# Altium schematic sheet P2.schdoc
size 594 x 421 mm; Symbol: Sheet-Symbol_A4; Company: 嘉立创EDA; Version: V1.0; Page Size: A2; @Project Name: 基于裕太微YT9215S的五口千兆交换机; @Page Count: 2; @Update Date: 2023-09-12; @Create Date: 2023-09-12; @Schematic Name: schematic1; @Page No: 2; @Page Name: P2; Device: Sheet-Symbol_A4
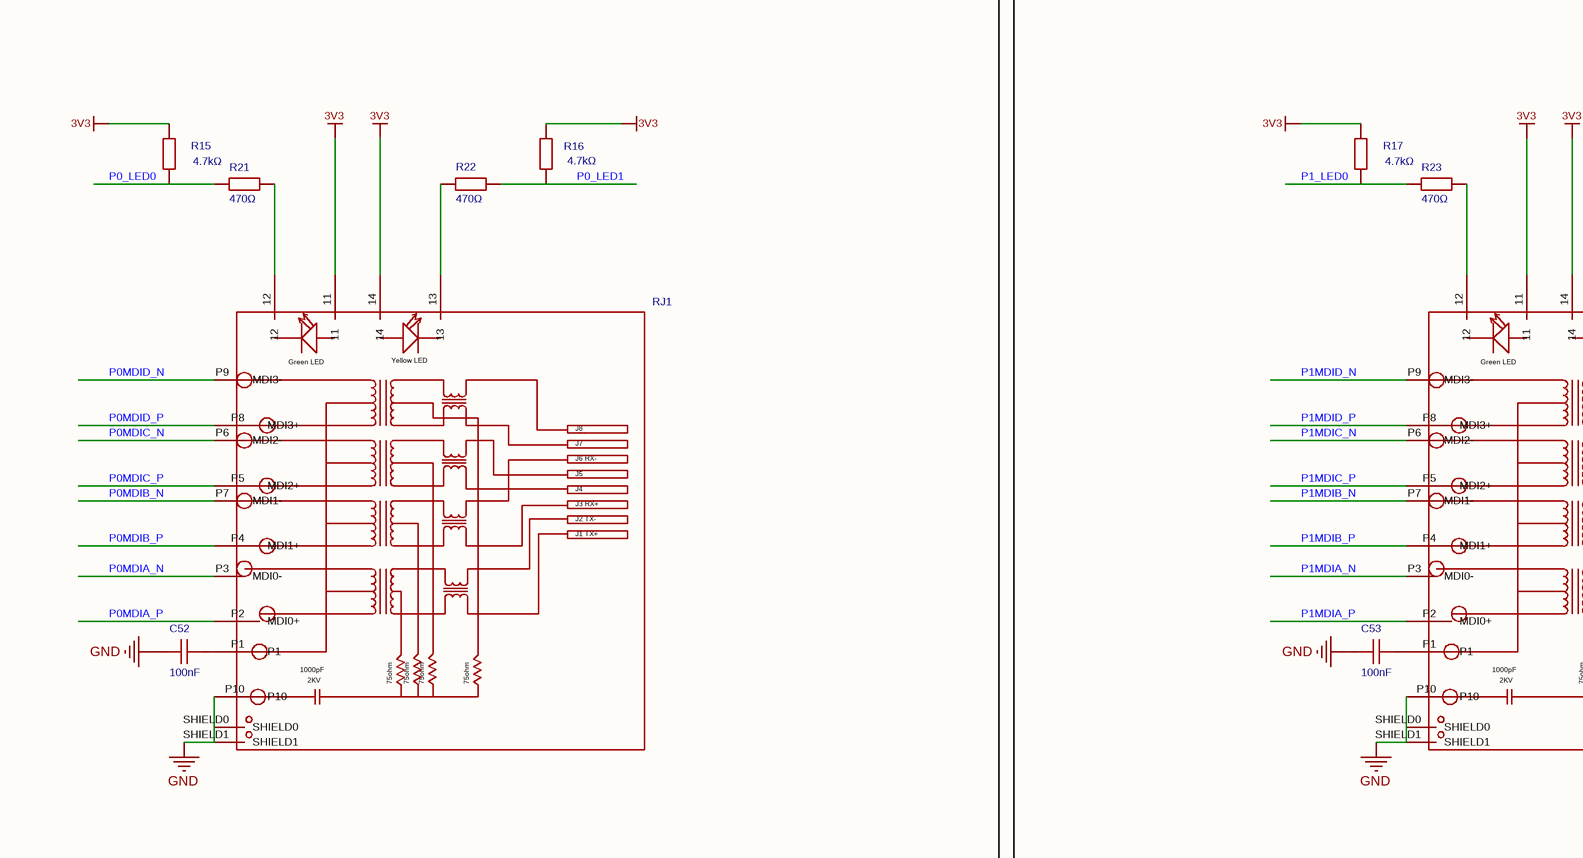
[diagram p0: P2.schdoc, top left]
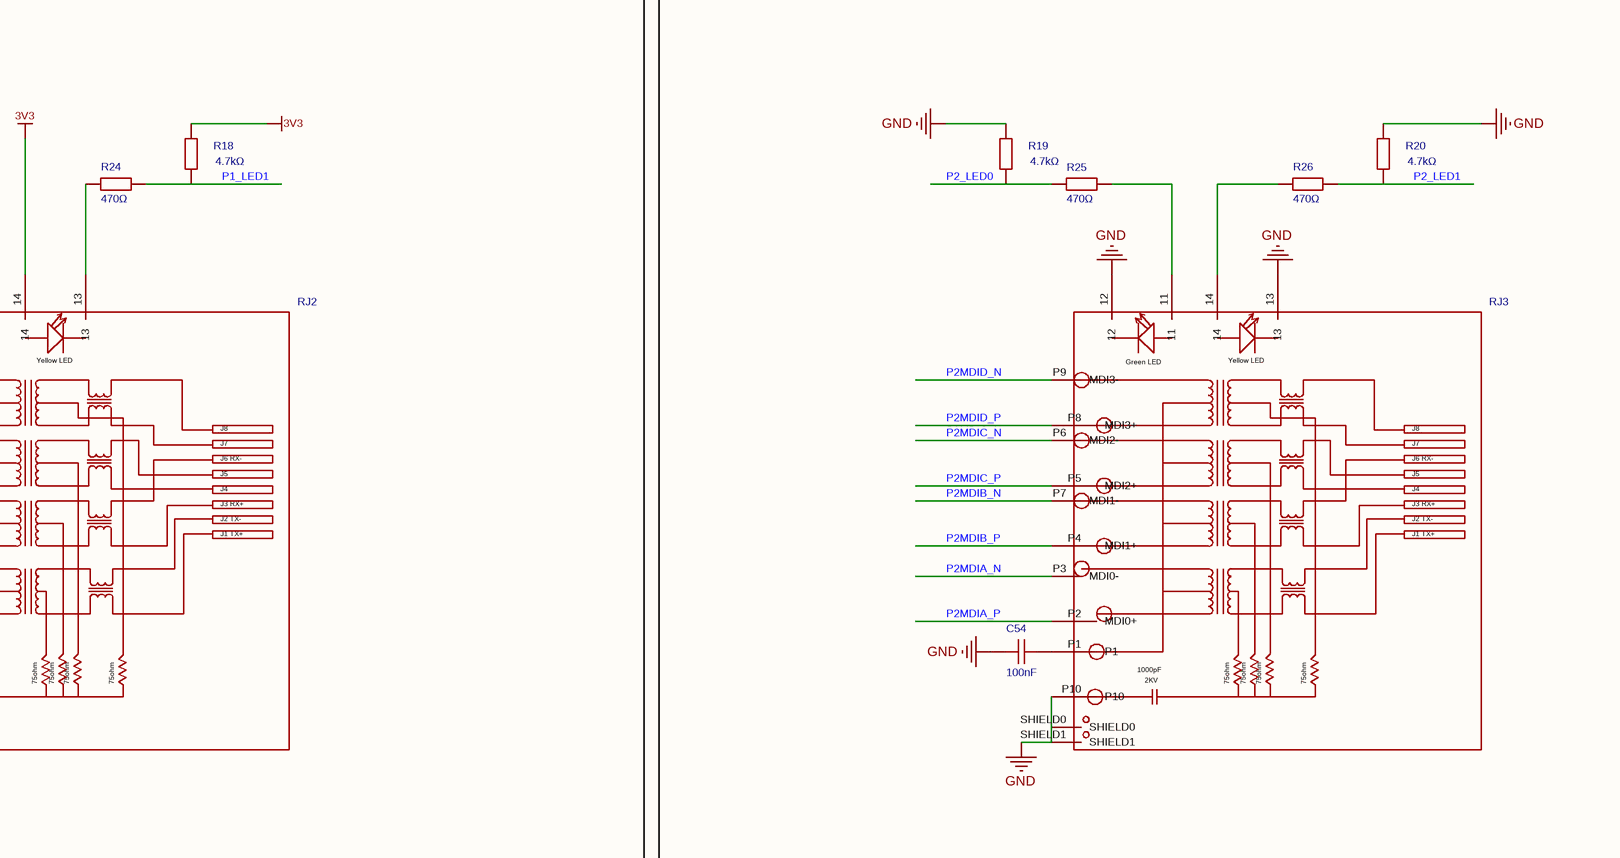
[diagram p1: P2.schdoc, top right]
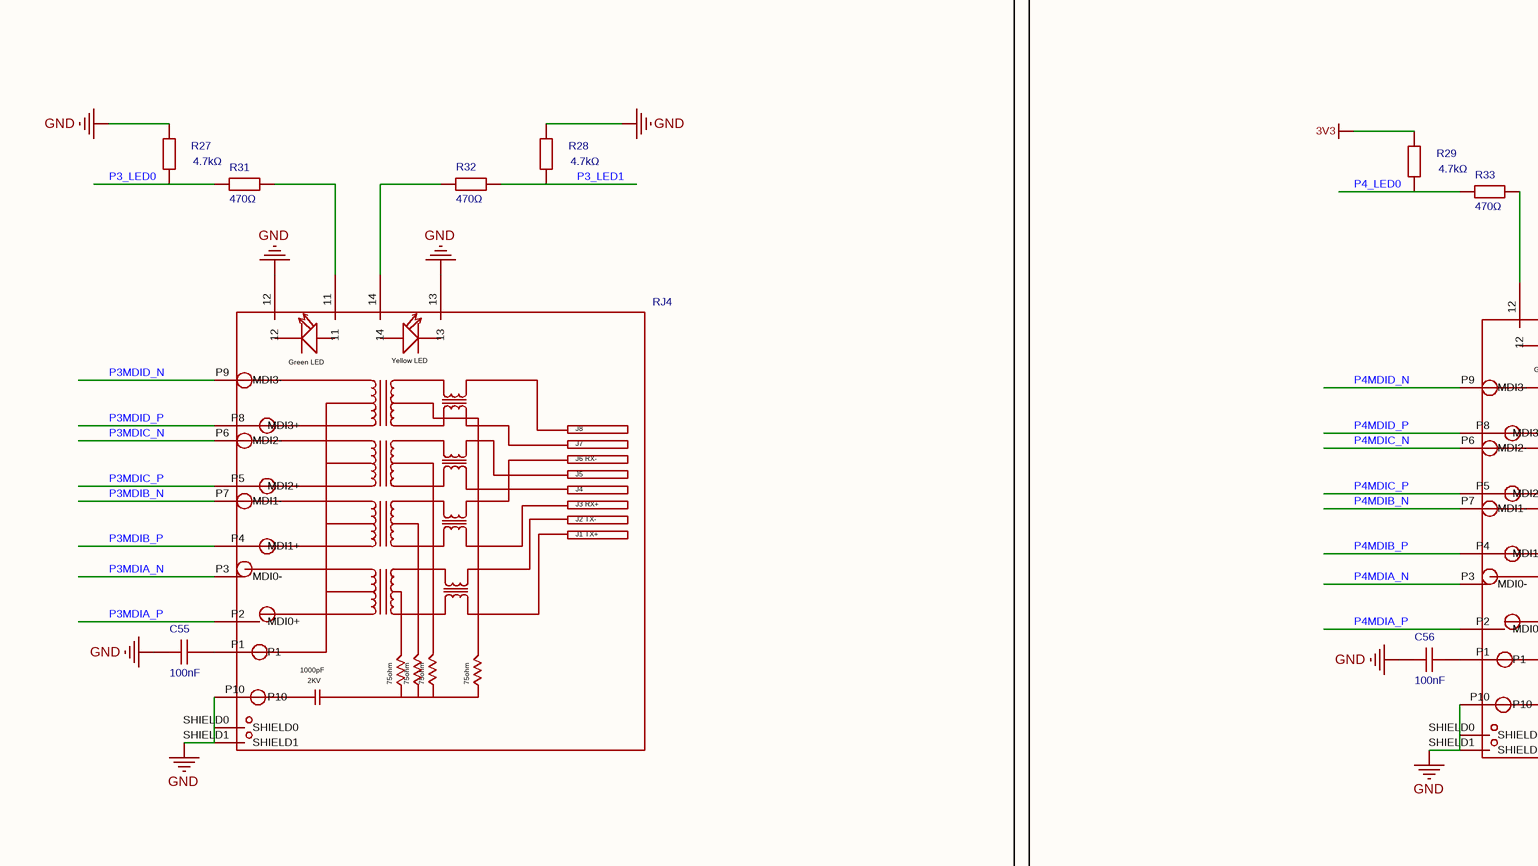
[diagram p2: P2.schdoc, bottom left]
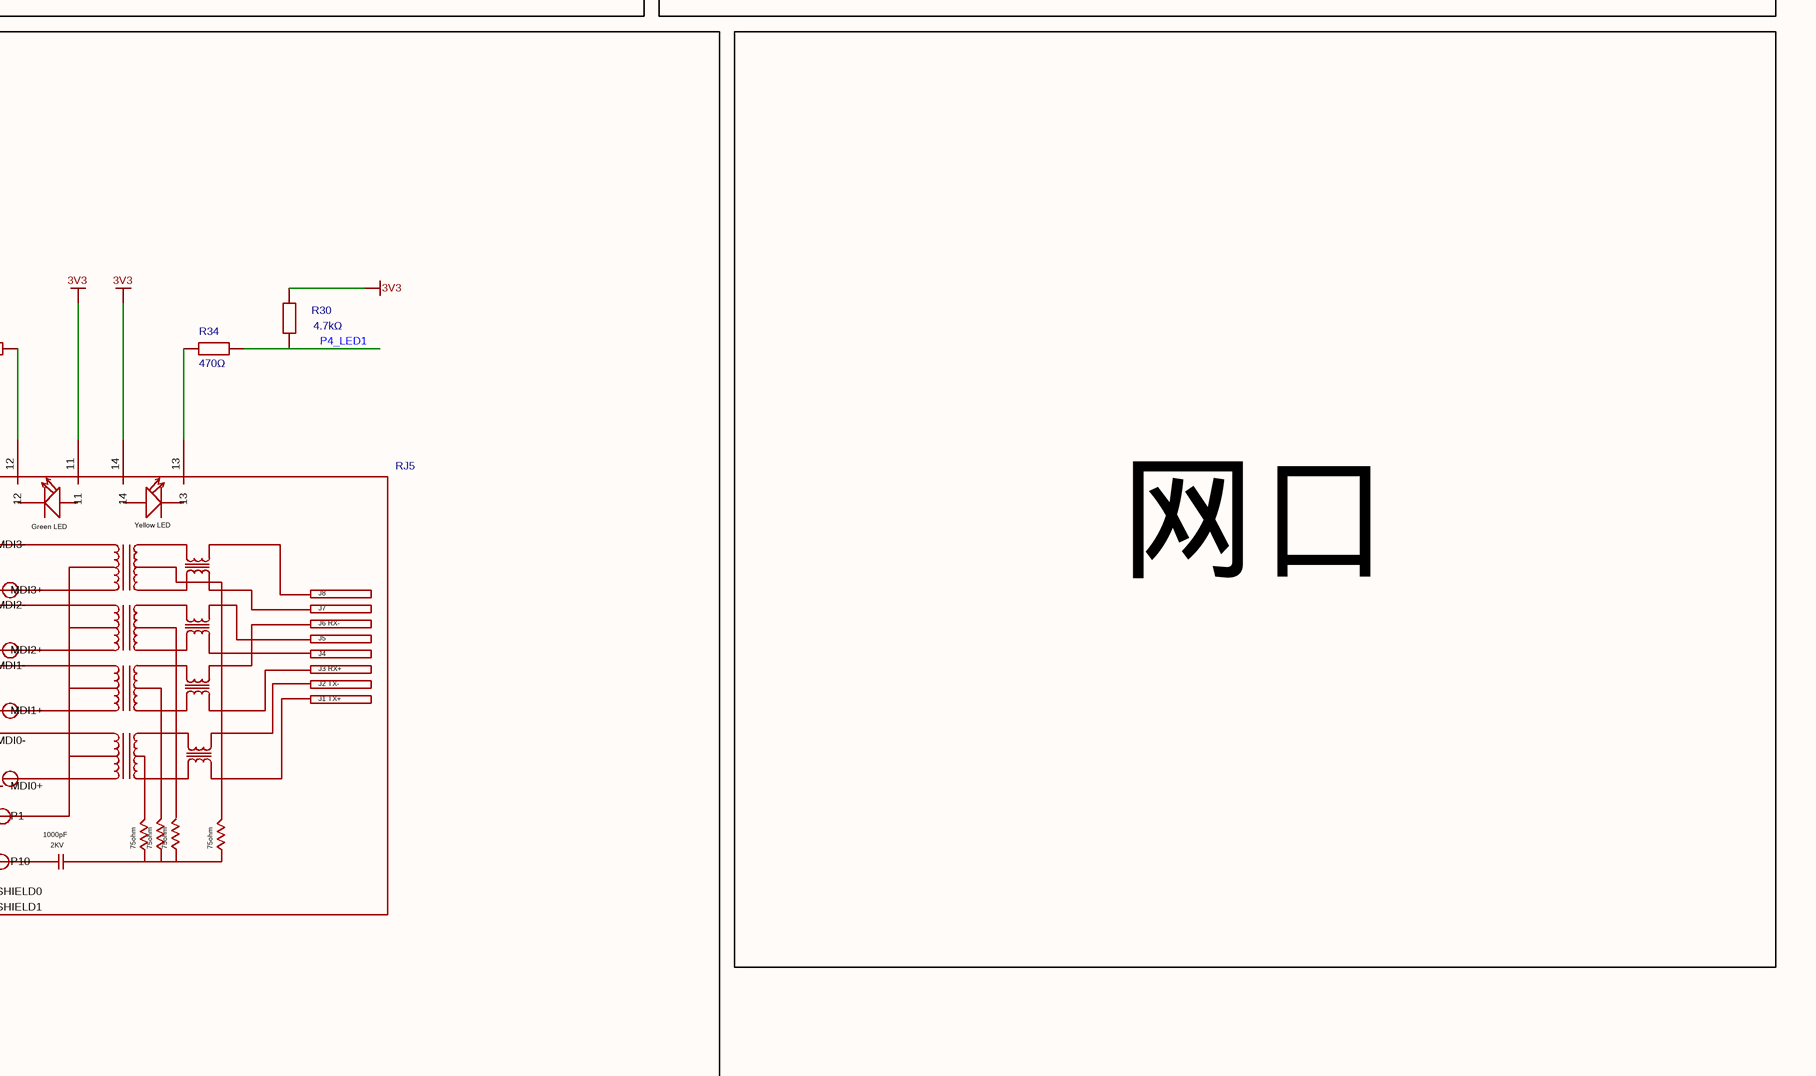
[diagram p3: P2.schdoc, bottom right]

## Parts
C52  100nF  [C0402]
C53  100nF  [C0402]
C54  100nF  [C0402]
C55  100nF  [C0402]
C56  100nF  [C0402]
R15  4.7kΩ  [R0402]
R16  4.7kΩ  [R0402]
R17  4.7kΩ  [R0402]
R18  4.7kΩ  [R0402]
R19  4.7kΩ  [R0402]
R20  4.7kΩ  [R0402]
R21  470Ω  [R0402]
R22  470Ω  [R0402]
R23  470Ω  [R0402]
R24  470Ω  [R0402]
R25  470Ω  [R0402]
R26  470Ω  [R0402]
R27  4.7kΩ  [R0402]
R28  4.7kΩ  [R0402]
R29  4.7kΩ  [R0402]
R30  4.7kΩ  [R0402]
R31  470Ω  [R0402]
R32  470Ω  [R0402]
R33  470Ω  [R0402]
R34  470Ω  [R0402]
RJ1  HR911130A  [RJ45-TH_HR911130A]  (value not drawn)
RJ2  HR911130A  [RJ45-TH_HR911130A]  (value not drawn)
RJ3  HR911130A  [RJ45-TH_HR911130A]  (value not drawn)
RJ4  HR911130A  [RJ45-TH_HR911130A]  (value not drawn)
RJ5  HR911130A  [RJ45-TH_HR911130A]  (value not drawn)

## Nets
3V3: R15.2 R16.2 R17.2 R18.2 R29.2 R30.2 RJ1.11 RJ1.14 RJ2.11 RJ2.14 RJ5.11 RJ5.14
GND: C52.1 C53.1 C54.1 C55.1 C56.1 R19.2 R20.2 R27.2 R28.2 RJ1.P10 RJ1.SHIELD0 RJ1.SHIELD1 RJ2.P10 RJ2.SHIELD0 RJ2.SHIELD1 RJ3.12 RJ3.13 RJ3.P10 RJ3.SHIELD0 RJ3.SHIELD1 RJ4.12 RJ4.13 RJ4.P10 RJ4.SHIELD0 RJ4.SHIELD1 RJ5.P10 RJ5.SHIELD0 RJ5.SHIELD1
P0_LED0: R15.1 R21.1
P0_LED1: R16.1 R22.2
P0MDIA_N: RJ1.P3(MDI0-)
P0MDIA_P: RJ1.P2(MDI0+)
P0MDIB_N: RJ1.P7(MDI1-)
P0MDIB_P: RJ1.P4(MDI1+)
P0MDIC_N: RJ1.P6(MDI2-)
P0MDIC_P: RJ1.P5(MDI2+)
P0MDID_N: RJ1.P9(MDI3-)
P0MDID_P: RJ1.P8(MDI3+)
P1_LED0: R17.1 R23.1
P1_LED1: R18.1 R24.2
P1MDIA_N: RJ2.P3(MDI0-)
P1MDIA_P: RJ2.P2(MDI0+)
P1MDIB_N: RJ2.P7(MDI1-)
P1MDIB_P: RJ2.P4(MDI1+)
P1MDIC_N: RJ2.P6(MDI2-)
P1MDIC_P: RJ2.P5(MDI2+)
P1MDID_N: RJ2.P9(MDI3-)
P1MDID_P: RJ2.P8(MDI3+)
P2_LED0: R19.1 R25.1
P2_LED1: R20.1 R26.2
P2MDIA_N: RJ3.P3(MDI0-)
P2MDIA_P: RJ3.P2(MDI0+)
P2MDIB_N: RJ3.P7(MDI1-)
P2MDIB_P: RJ3.P4(MDI1+)
P2MDIC_N: RJ3.P6(MDI2-)
P2MDIC_P: RJ3.P5(MDI2+)
P2MDID_N: RJ3.P9(MDI3-)
P2MDID_P: RJ3.P8(MDI3+)
P3_LED0: R27.1 R31.1
P3_LED1: R28.1 R32.2
P3MDIA_N: RJ4.P3(MDI0-)
P3MDIA_P: RJ4.P2(MDI0+)
P3MDIB_N: RJ4.P7(MDI1-)
P3MDIB_P: RJ4.P4(MDI1+)
P3MDIC_N: RJ4.P6(MDI2-)
P3MDIC_P: RJ4.P5(MDI2+)
P3MDID_N: RJ4.P9(MDI3-)
P3MDID_P: RJ4.P8(MDI3+)
P4_LED0: R29.1 R33.1
P4_LED1: R30.1 R34.2
P4MDIA_N: RJ5.P3(MDI0-)
P4MDIA_P: RJ5.P2(MDI0+)
P4MDIB_N: RJ5.P7(MDI1-)
P4MDIB_P: RJ5.P4(MDI1+)
P4MDIC_N: RJ5.P6(MDI2-)
P4MDIC_P: RJ5.P5(MDI2+)
P4MDID_N: RJ5.P9(MDI3-)
P4MDID_P: RJ5.P8(MDI3+)
NetC52_2: C52.2 RJ1.P1
NetC53_2: C53.2 RJ2.P1
NetC54_2: C54.2 RJ3.P1
NetC55_2: C55.2 RJ4.P1
NetC56_2: C56.2 RJ5.P1
NetR21_2: R21.2 RJ1.12
NetR22_1: R22.1 RJ1.13
NetR23_2: R23.2 RJ2.12
NetR24_1: R24.1 RJ2.13
NetR25_2: R25.2 RJ3.11
NetR26_1: R26.1 RJ3.14
NetR31_2: R31.2 RJ4.11
NetR32_1: R32.1 RJ4.14
NetR33_2: R33.2 RJ5.12
NetR34_1: R34.1 RJ5.13

## Notes on the sheet
- 网口
- 更新日期
- 2023-09-12
- 原理图
- 图页
- schematic1
- P2
- 创建日期
- 物料编码
- 审阅
- 绘制
- 基于裕太微YT9215S的五口千兆交换机
- 版本
- V1.0
- 尺寸
- A2
- 页
- 2
- 嘉立创EDA
- 共
- (in symbol HR911130A) Green LED; Yellow LED; J8; J7; J6 RX-; J5; J4; J3 RX+; J2 TX-; J1 TX+; 1000pF; 2KV; 75ohm

## Library data of the parts
C52-C56 = FN15X104K250PNG: 容值:100nF;精度:±10%;额定电压:25V;材质(温度系数):X7R;; Manufacturer: PSA(信昌电陶); AddInBom: yes; ModelId: 36a51122f27c49738f86b3bfa98863e0; ModelName: C0402_L1.0-W0.5-H0.5; ModelTransform: 39.37,19.685,0,0,0,0,0,0,0; Tolerance: ±10%; Voltage Rated: 25V; Temperature Coefficient: X7R; Symbol: fn15x104k250png; Value: 100nF; Device: FN15X104K250PNG; LCSC Part Name: 100nF ±10% 25V; SupplierPart: C525225; ManufacturerPart: FN15X104K250PNG; Supplier Footprint: 0402; JLCPCB Part Class: Extended Part; Datasheet: https://atta.szlcsc.com/upload/public/pdf/source/20200506/C436246_4EAA78C9048D88437BAF2CB7B8BE45FD.pdf; Supplier: LCSC; ConvertToPcb: yes; FootprintName: C0402
R15-R20 R27-R30 = 0402WGF4701TCE: 电阻类型:厚膜电阻;阻值:4.7kΩ;精度:±1%;功率:62.5mW;; Manufacturer: UNI-ROYAL(厚声); Symbol: tr0402d10kq1025; Temperature Coefficient: ±100ppm/℃; AddInBom: yes; ModelId: 671aefced39d4c318694bba8bd8efd39; ModelName: R0402_L1.0-W0.5-H0.5; ModelTransform: 39.37,19.685,0,0,0,0,0,0.0005,0; Tolerance: ±1%; Power(Watts): 62.5mW; Overload Voltage (Max): 50V; Value: 4.7kΩ; Operating Temperature Range: -55℃~+155℃; Device: 0402WGF4701TCE; LCSC Part Name: 4.7kΩ ±1% 62.5mW; SupplierPart: C25900; ManufacturerPart: 0402WGF4701TCE; Supplier Footprint: 0402; JLCPCB Part Class: Basic Part; Datasheet: https://atta.szlcsc.com/upload/public/pdf/source/20200306/C422600_1E6D84923E4A46A82E41ADD87F860B5C.pdf; Supplier: LCSC; ConvertToPcb: yes; FootprintName: R0402; Type: 厚膜电阻
R21-R26 R31-R34 = 0402WGF4700TCE: 电阻类型:厚膜电阻;阻值:470Ω;精度:±1%;功率:62.5mW;; Manufacturer: UNI-ROYAL(厚声); Symbol: tr0402d10kq1025; Temperature Coefficient: ±100ppm/℃; AddInBom: yes; ModelId: 671aefced39d4c318694bba8bd8efd39; ModelName: R0402_L1.0-W0.5-H0.5; ModelTransform: 39.37,19.685,0,0,0,0,0,0.0005,0; Tolerance: ±1%; Power(Watts): 62.5mW; Overload Voltage (Max): 50V; Value: 470Ω; Device: 0402WGF4700TCE; Operating Temperature Range: -55℃~+155℃; LCSC Part Name: 470Ω ±1% 62.5mW; SupplierPart: C25117; ManufacturerPart: 0402WGF4700TCE; Supplier Footprint: 0402; JLCPCB Part Class: Basic Part; Datasheet: https://atta.szlcsc.com/upload/public/pdf/source/20200306/C422600_1E6D84923E4A46A82E41ADD87F860B5C.pdf; Supplier: LCSC; ConvertToPcb: yes; FootprintName: R0402; Type: 厚膜电阻
RJ1-RJ5 = HR911130A: 连接器类型:插座;USOC代码:RJ45;端口数量:1;等级:-;屏蔽:-;LED:有;; Manufacturer: HANRUN(汉仁); 3D Model Transform: 645.668,866.14,0,180,0,0,0,87.539,-137.795; AddInBom: yes; ModelId: d88c4926104f4f348c70d31865ddc9c9; ModelName: RJ45-TH_10P-L21.3-W16.0-H13.5; Connector Type: 插座; USOC Codes: RJ45; Number of Ports: 1; LED: 有; JLCPCB Part Class: Extended Part; Symbol: hr911130a; Device: HR911130A; LCSC Part Name: HR911130A; SupplierPart: C54408; ManufacturerPart: HR911130A; Supplier Footprint: Through Hole; Datasheet: 2022-01-08/236921A/bb93d1b97a1c43f7a2520317d0b76856/C54408_RJ45_2015-10-14.PDF; Supplier: LCSC; ConvertToPcb: yes; FootprintName: RJ45-TH_HR911130A; Ratings: -; Shielding: -